# EAGLE design proto_tranc_1 (EAGLE 6.5.0)
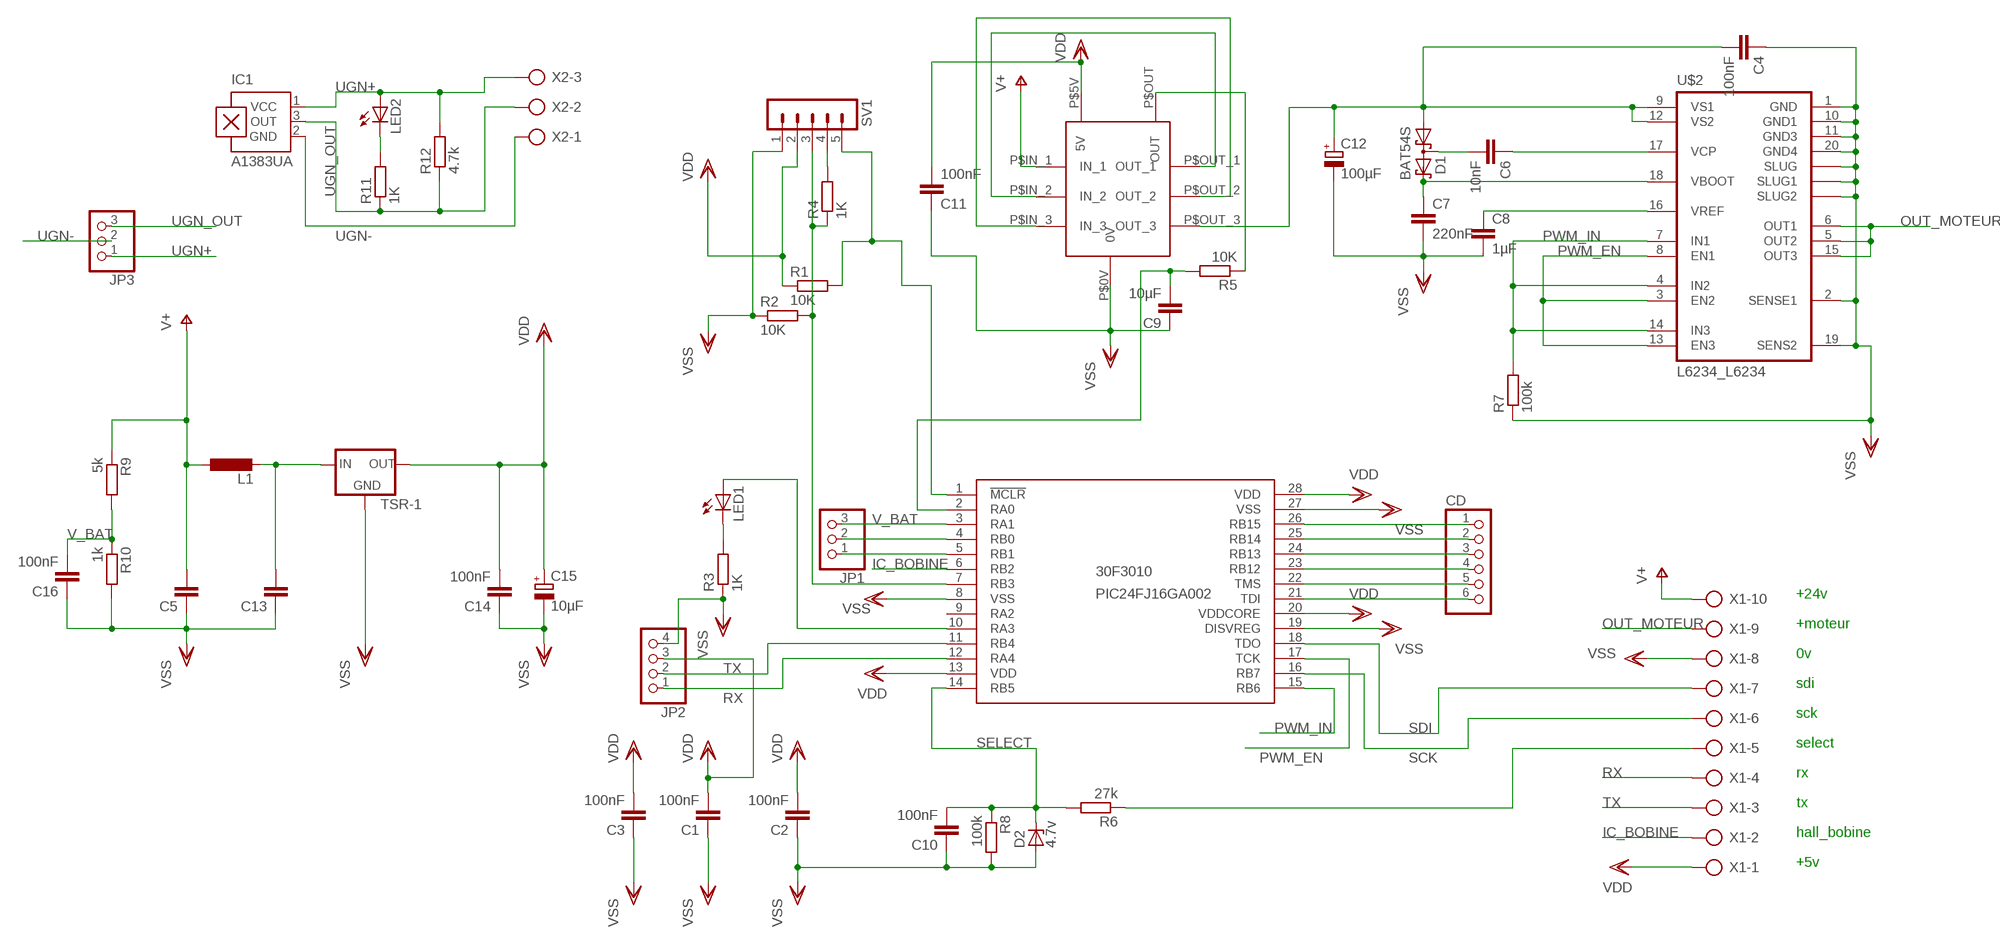
[diagram p0: schematic, sheet 1]

## Parts
30F3010  PIC24FJ16GA002  [DIL28-3]
C1  100nF  C-EUC0805K  [C0805K]
C2  100nF  C-EUC0805K  [C0805K]
C3  100nF  C-EUC0805K  [C0805K]
C4  100nF  C-EUC0805K  [C0805K]
C5  C-EUC1206K  [C1206K]
C6  10nF  C-EUC0805K  [C0805K]
C7  220nF  C-EUC0805K  [C0805K]
C8  1µF  C-EUC0805K  [C0805K]
C9  10µF  C-EUC1812  [C1812]
C10  100nF  C-EUC0805K  [C0805K]
C11  100nF  C-EUC0805K  [C0805K]
C12  100µF  CPOL-EUTT5D11L  [TT5D11L]
C13  C-EUC1206K  [C1206K]
C14  100nF  C-EUC0805K  [C0805K]
C15  10µF  CPOL-EUSMCB  [SMC_B]
C16  100nF  C-EUC0805K  [C0805K]
CD  PINHD-1X6  [1X06]
D1  BAT54S  [SOT23]
D2  4.7v  1N4728  [DO41Z10]
IC1  A1383UA  [SIP3-UA]
JP1  PINHD-1X3  [1X03]
JP2  PINHD-1X4  [1X04]
JP3  PINHD-1X3  [1X03]
L1  L-EUL2012C  [L2012C]
LED1  LEDCHIPLED_1206  [CHIPLED_1206]
LED2  LEDCHIPLED_0805  [CHIPLED_0805]
R1  10K  R-EU_M0805  [M0805]
R2  10K  R-EU_M0805  [M0805]
R3  1K  R-EU_M0805  [M0805]
R4  1K  R-EU_M0805  [M0805]
R5  10K  R-EU_M0805  [M0805]
R6  27k  R-EU_M0805  [M0805]
R7  100k  R-EU_M0805  [M0805]
R8  100k  R-EU_M0805  [M0805]
R9  5k  R-EU_M0805  [M0805]
R10  1k  R-EU_M0805  [M0805]
R11  1K  R-EU_M0805  [M0805]
R12  4.7k  R-EU_M0805  [M0805]
SV1  MA05-1  [MA05-1]
TSR-1  78XXS  [78XXS]
U$1  LTS25-NP  [LTS25]
U$2  L6234_L6234  [L6234_SO20POWER2]
X1  AK300/10  [AK300/10]
X2  AK300/3  [AK300/3]

## Nets
IC_BOBINE: 30F3010.6(RB2) X1.2
N$1: C13.2 L1.2 TSR-1.IN
N$2: U$1.P$IN_2(IN_2) U$1.P$OUT_1(OUT_1)
N$3: R4.2 SV1.4
N$4: 30F3010.26(RB15) CD.1
N$5: U$1.P$IN_3(IN_3) U$1.P$OUT_2(OUT_2)
N$6: 30F3010.10(RA3) LED1.A
N$7: C4.2 C12.+ D1.1(A1) U$1.P$OUT_3(OUT_3) U$2.9(VS1) U$2.12(VS2)
N$8: R5.1 U$1.P$OUT(OUT)
N$9: 30F3010.2(RA0) C9.2 R5.2
N$10: C6.2 D1.3(C1A2)
N$11: C6.1 U$2.17(VCP)
N$12: C7.1 D1.2(C2) U$2.18(VBOOT)
N$13: C8.1 U$2.16(VREF)
N$15: 30F3010.25(RB14) CD.2
N$16: 30F3010.1(!MCLR) R1.2 SV1.5
N$17: 30F3010.7(RB3) R2.2 R4.1 SV1.3
N$18: 30F3010.24(RB13) CD.3
N$19: 30F3010.23(RB12) CD.4
N$20: 30F3010.22(TMS) CD.5
N$21: 30F3010.21(TDI) CD.6
N$22: R6.1 X1.5
N$23: LED1.C R3.2
N$24: 30F3010.4(RB0) JP1.2
N$25: 30F3010.5(RB1) JP1.1
N$27: LED2.C R11.2
OUT_MOTEUR: U$2.5(OUT2) U$2.6(OUT1) U$2.15(OUT3) X1.9
PWM_EN: 30F3010.17(TCK) U$2.3(EN2) U$2.8(EN1) U$2.13(EN3)
PWM_IN: 30F3010.15(RB6) R7.2 U$2.4(IN2) U$2.7(IN1) U$2.14(IN3)
RX: 30F3010.12(RA4) JP2.1 X1.4
SCK: 30F3010.16(RB7) X1.6
SDI: 30F3010.18(TDO) X1.7
SELECT: 30F3010.14(RB5) C10.2 D2.C R6.2 R8.1
TX: 30F3010.11(RB4) JP2.2 X1.3
UGN+: IC1.1(VCC) JP3.1 LED2.A R12.2 X2.3
UGN-: IC1.2(GND) JP3.2 X2.1
UGN_OUT: IC1.3(OUT) JP3.3 R11.1 R12.1 X2.2
V+: C5.2 L1.1 R9.1 U$1.P$IN_1(IN_1) X1.10
V_BAT: 30F3010.3(RA1) C16.2 JP1.3 R9.2 R10.1
VDD: 30F3010.13(VDD) 30F3010.20(VDDCORE) 30F3010.28(VDD) C1.2 C2.2 C3.2 C11.2 C14.2 C15.+ JP2.3 R1.1 SV1.2 TSR-1.OUT U$1.P$5V(5V) X1.1
VSS: 30F3010.8(VSS) 30F3010.19(DISVREG) 30F3010.27(VSS) C1.1 C2.1 C3.1 C4.1 C5.1 C7.2 C8.2 C9.1 C10.1 C11.1 C12.- C13.1 C14.1 C15.- C16.1 D2.A JP2.4 R2.1 R3.1 R7.1 R8.2 R10.2 SV1.1 TSR-1.GND U$1.P$0V(0V) U$2.1(GND) U$2.2(SENSE1) U$2.10(GND1) U$2.11(GND3) U$2.19(SENS2) U$2.20(GND4) U$2.SLUG1(SLUG2) U$2.SLUG2(SLUG) U$2.SLUG(SLUG1) X1.8
Unconnected: 30F3010.9(RA2)

## Notes on the sheet
- +24v
- +moteur
- 0v
- sdi
- sck
- select
- rx
- tx
- hall_bobine
- +5v

## Library data of the parts
30F3010 = microchip:PIC24FJ16GA002: PIC24FJ16GA002 edit this description Auto generated by make-symbol-device-package-bsdl.ulp Rev. 25 Source: PIC24FJ16GA002.bsd; MPN: PIC24FJ16GA002-I/SP; OC_FARNELL: 1816078; OC_NEWARK: 40M1427
C1-C11 C13 C14 C16 = rcl:C-EU: CAPACITOR, European symbol
C12 C15 = rcl:CPOL-EU: POLARIZED CAPACITOR, European symbol
CD = pinhead:PINHD-1X6: PIN HEADER
D1 = diode:BAT54S: Schottky Diodes Pin connection corrected 2011-05-04 Source: Fairchild .. BAT54.pdf
D2 = diode:1N4728: Z DIODE 3.3 V, 1W, 5 percent
IC1 = allegro:A13*?: Linear Hall Effect Sensor ICs Continuous-Time Ratiometric High-Temperature Operation Programmable Linear with Analog Output A1302 -Replacement- UGN3503 Source: http://www.allegromicro.com/en/Products/Part_Numbers/1301/1301.pdf http://www.allegromicro.com/en/Products/Part_Numbers/1321/1321.pdf http://www.allegromicro.com/en/Products/Part_Numbers/1381/1381.pdf; MPN: A1383LUA-T; OC_FARNELL: unknown; OC_NEWARK: 30M9957
JP1 JP3 = pinhead:PINHD-1X3: PIN HEADER
JP2 = pinhead:PINHD-1X4: PIN HEADER
L1 = rcl:L-EU: INDUCTOR, European symbol
LED1 LED2 = led:LED: LED OSRAM: - CHIPLED LG R971, LG N971, LY N971, LG Q971, LY Q971, LO R971, LY R971 LH N974, LH R974 LS Q976, LO Q976, LY Q976 LO Q996 - Hyper CHIPLED LW Q18S LB Q993, LB Q99A, LB R99A - SideLED LS A670, LO A670, LY A670, LG A670, LP A670 LB A673, LV A673, LT A673, LW A673 LH A674 LY A675 LS A676, LA A676, LO A676, LY A676, LW A676 LS A679, LY A679, LG A679 - Hyper Micro SIDELED® LS Y876, LA Y876, LO Y876, LY Y876 LT Y87S - SmartLED LW L88C, LW L88S LB L89C, LB L89S, LG L890 LS L89K, LO L89K, LY L89K LS L896, LA L896, LO L896, LY L896 - TOPLED LS T670, LO T670, LY T670, LG T670, LP T670 LSG T670, LSP T670, LSY T670, LOP T670, LYG T670 LG T671, LOG T671, LSG T671 LB T673, LV T673, LT T673, LW T673 LH T674 LS T676, LA T676, LO T676, LY T676, LB T676, LH T676, LSB T676, LW T676 LB T67C, LV T67C, LT T67C, LS T67K, LO T67K, LY T67K, LW E67C LS E67B, LA E67B, LO E67B, LY E67B, LB E67C, LV E67C, LT E67C LW T67C LS T679, LY T679, LG T679 LS T770, LO T770, LY T770, LG T770, LP T770 LB T773, LV T773, LT T773, LW T773 LH T774 LS E675, LA E675, LY E675, LS T675 LS T776, LA T776, LO T776, LY T776, LB T776 LHGB T686 LT T68C, LB T68C - Hyper Mini TOPLED® LB M676 - Mini TOPLED Santana® LG M470 LS M47K, LO M47K, LY M47K Source: http://www.osram.convergy.de LUXEON: - LUMILED® LXK2-PW12-R00, LXK2-PW12-S00, LXK2-PW14-U00, LXK2-PW14-V00 LXK2-PM12-R00, LXK2-PM12-S00, LXK2-PM14-U00 LXK2-PE12-Q00, LXK2-PE12-R00, LXK2-PE12-S00, LXK2-PE14-T00, LXK2-PE14-U00 LXK2-PB12-K00, LXK2-PB12-L00, LXK2-PB12-M00, LXK2-PB14-N00, LXK2-PB14-P00, LXK2-PB14-Q00 LXK2-PR12-L00, LXK2-PR12-M00, LXK2-PR14-Q00, LXK2-PR14-R00 LXK2-PD12-Q00, LXK2-PD12-R00, LXK2-PD12-S00 LXK2-PH12-R00, LXK2-PH12-S00 LXK2-PL12-P00, LXK2-PL12-Q00, LXK2-PL12-R00 Source: www.luxeon.com KINGBRIGHT: KA-3528ASYC Source: www.kingbright.com
R1-R12 = rcl:R-EU_: RESISTOR, European symbol
SV1 = con-lstb:MA05-1: PIN HEADER; OC_FARNELL: unknown; OC_NEWARK: unknown
TSR-1 = v-reg:78XXS: VOLTAGE REGULATOR
U$1 = lem:LTS25-NP
U$2 = 009:L6234_L6234
X1 = con-ptr500:AK300/10: CONNECTOR; OC_FARNELL: unknown; OC_NEWARK: unknown
X2 = con-ptr500:AK300/3: CONNECTOR; OC_FARNELL: unknown; OC_NEWARK: unknown

## Board
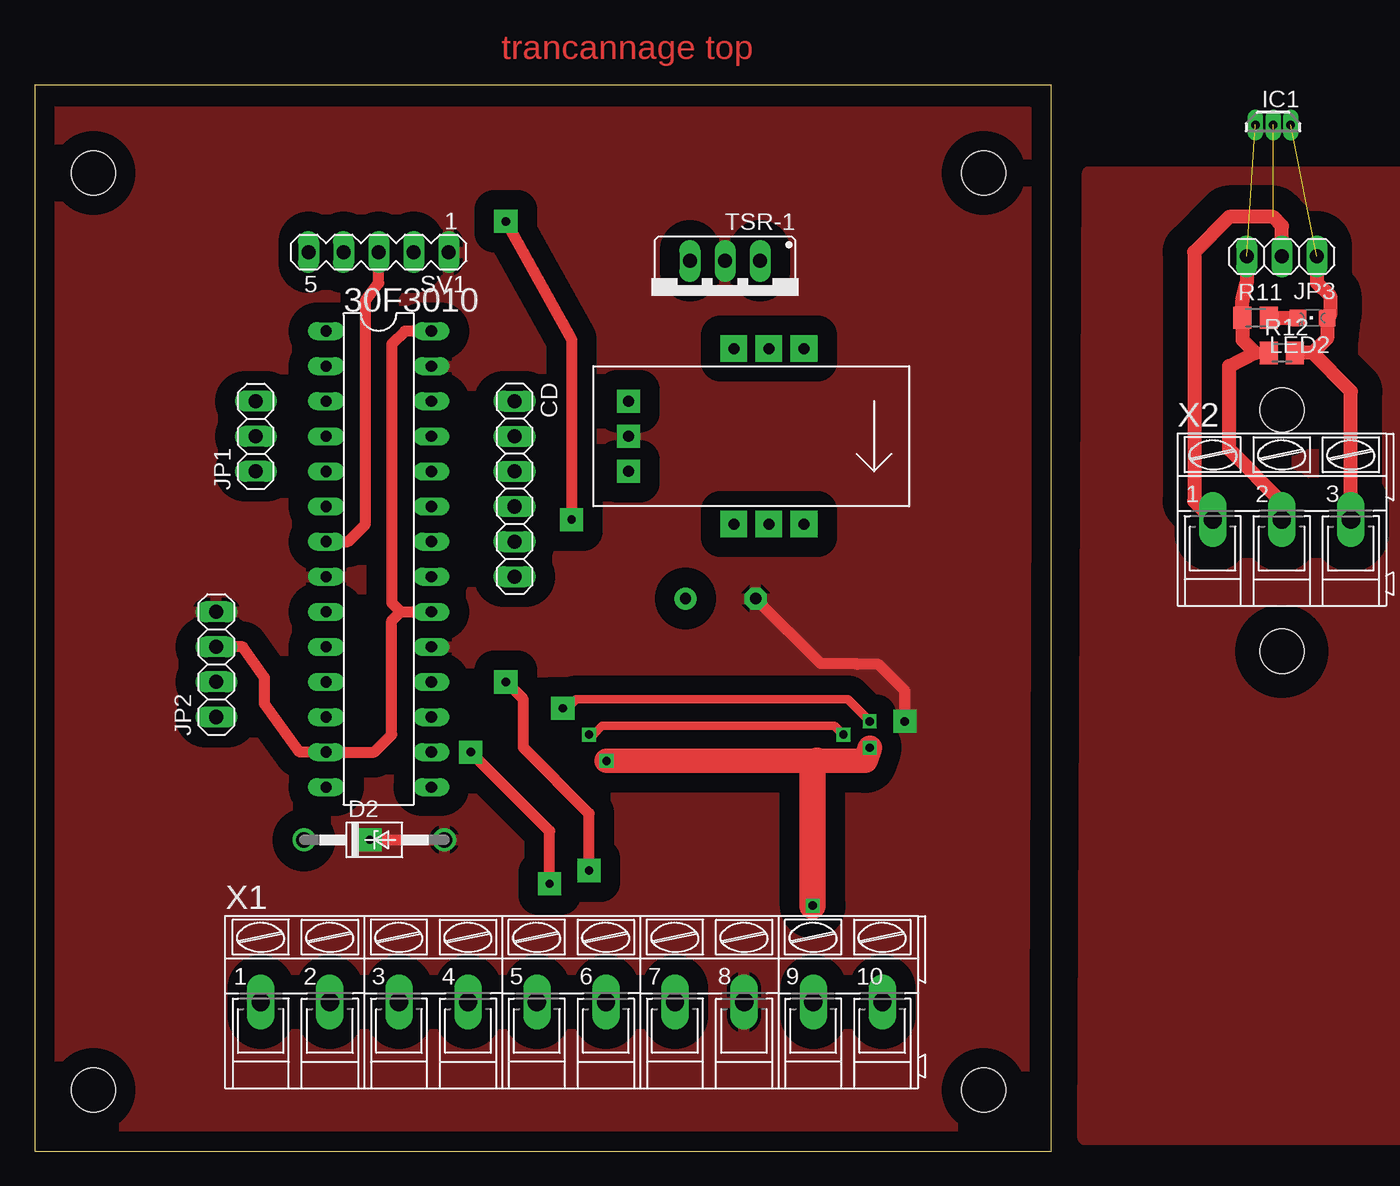
[diagram p1: board, top side]
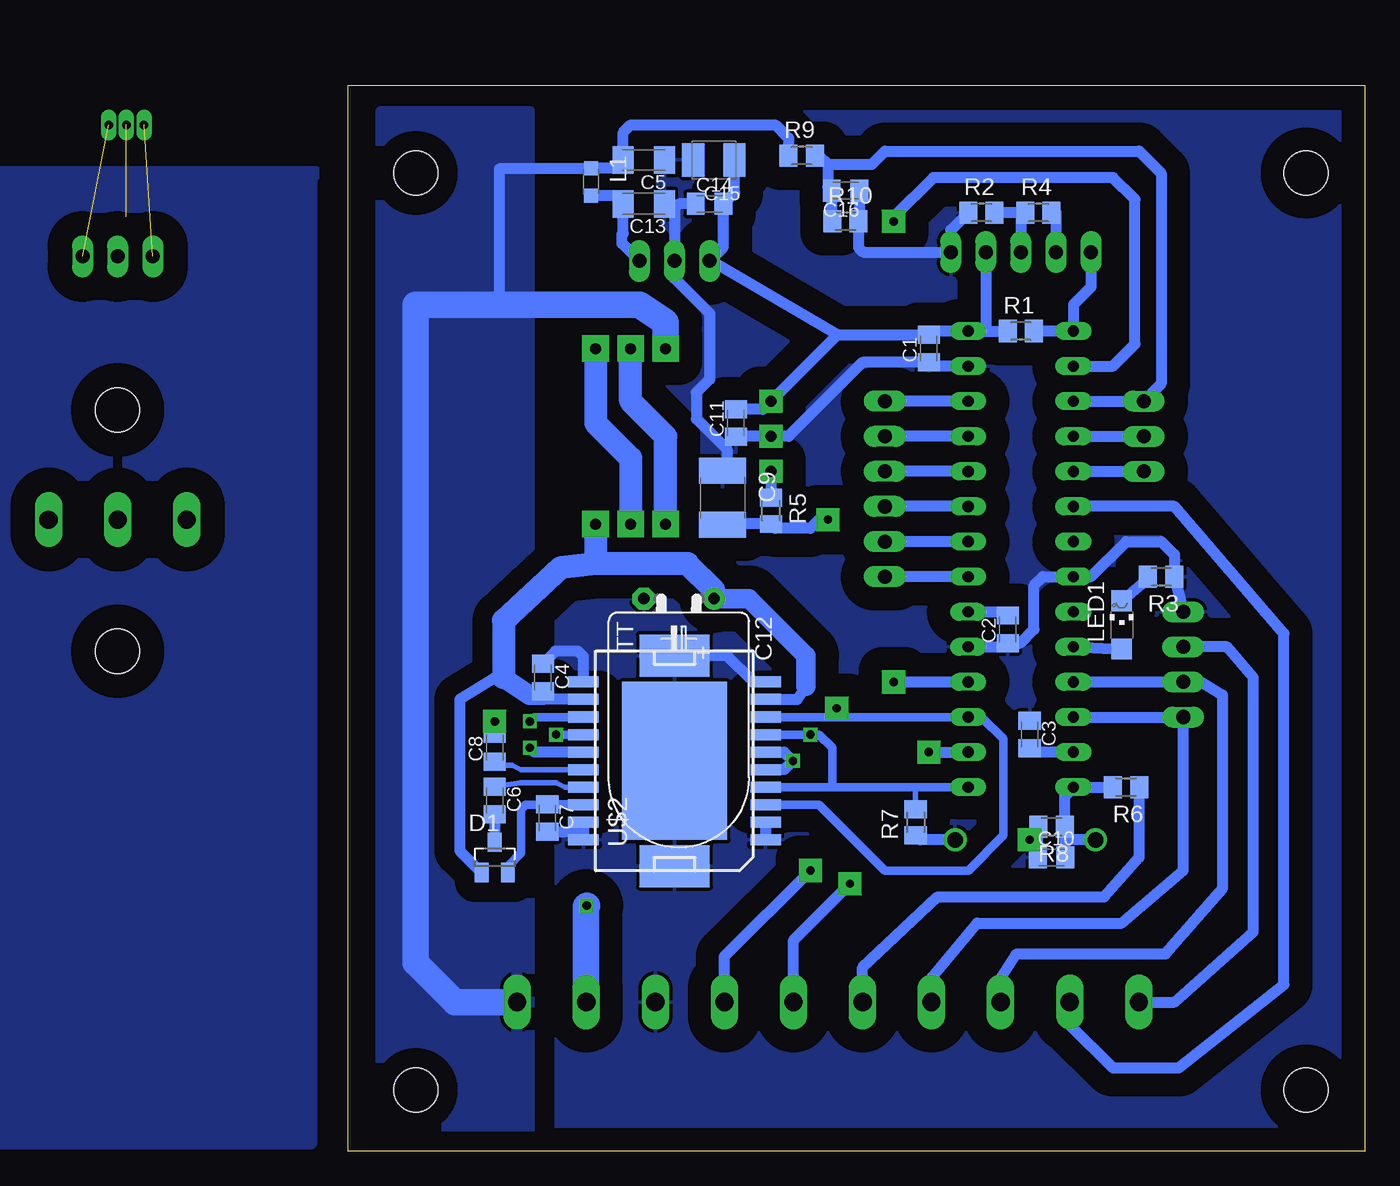
[diagram p2: board, bottom side, seen from below]

Size 73.65 x 77.14 mm. Coordinates in mm from the lower left corner, seen from the top.
Outline: 0,0 73.65,0 73.65,77.14 0,77.14 0,0
Copper layers (1*16): Top 0.035mm / dielectric 1.5mm / Bottom 0.035mm
Design rules "default": minimum track width 10mil, minimum drill 24mil, track to track 8mil, track to pad 8mil, pad to pad 8mil, via to via 8mil, smd to smd 8mil, copper to edge 40mil, drill to drill 8mil, minimum pad ring 10mil, minimum via ring 8mil, stop-mask expansion 4mil, vias tented up to drill 0mil, thermal gap 10mil
Holes 3.2 mm at 4.28,4.44 68.73,4.44 68.73,70.8 4.28,70.8 90.32,53.65 90.32,36.19

### Footprints (pad centres in the part's own frame; a part is rotated, then mirrored left to right if it is on the bottom)
DIL28-3 = drill 0.813 long: 1 -16.51,-3.81; 2 -13.97,-3.81; 3 -11.43,-3.81; 4 -8.89,-3.81; 5 -6.35,-3.81; 6 -3.81,-3.81; 7 -1.27,-3.81; 8 1.27,-3.81; 9 3.81,-3.81; 10 6.35,-3.81; 11 8.89,-3.81; 12 11.43,-3.81; 13 13.97,-3.81; 14 16.51,-3.81; 15 16.51,3.81; 16 13.97,3.81; 17 11.43,3.81; 18 8.89,3.81; 19 6.35,3.81; 20 3.81,3.81; 21 1.27,3.81; 22 -1.27,3.81; 23 -3.81,3.81; 24 -6.35,3.81; 25 -8.89,3.81; 26 -11.43,3.81; 27 -13.97,3.81; 28 -16.51,3.81
C0805K = smd 1.3 x 1.6: 1 -1,0; 2 1,0
C1206K = smd 1.5 x 2: 1 -1.5,0; 2 1.5,0
C1812 = smd 1.9 x 3.4: 1 -1.95,0; 2 1.95,0
TT5D11L = drill 0.813 pad 1.6: + -2.54,0 | drill 0.813 pad 1.6 octagon: - 2.54,0
SMC_B = smd 1.6 x 2.4: + -1.5,0; - 1.5,0
1X06 = drill 1.016 long: 1 -6.35,0; 2 -3.81,0; 3 -1.27,0; 4 1.27,0; 5 3.81,0; 6 6.35,0
SOT23 = smd 1 x 1.4: 1 -0.95,-1.1; 2 0.95,-1.1; 3 0,1.1
DO41Z10 = drill 1.118: A 5.08,0; C -5.08,0
SIP3-UA = drill 0.6 pad 0.7 long: 1 -1.27,0; 2 0,0; 3 1.27,0
1X03 = drill 1.016 long: 1 -2.54,0; 2 0,0; 3 2.54,0
1X04 = drill 1.016 long: 1 -3.81,0; 2 -1.27,0; 3 1.27,0; 4 3.81,0
L2012C = smd 1 x 1: 1 -1,0; 2 1,0
CHIPLED_1206 = smd 1.5 x 1.5: A 0,-1.75; C 0,1.75
CHIPLED_0805 = smd 1.2 x 1.2: A 0,-1.05; C 0,1.05
M0805 = smd 1.3 x 1.6: 1 -0.95,0; 2 0.95,0
MA05-1 = drill 1.016 long: 1 -5.08,0; 2 -2.54,0; 3 0,0; 4 2.54,0; 5 5.08,0
78XXS = drill 1.016 long: GND 0,-2.54; IN -2.54,-2.54; OUT 2.54,-2.54
LTS25 = drill 0.8 pad 1.676 square: P$0V -10.16,0; P$5V -10.16,2.54; P$OUT -10.16,-2.54 | drill 0.8 pad 1.93 square: P$IN_1 -2.54,6.35; P$IN_2 0,6.35; P$IN_3 2.54,6.35; P$OUT_1 -2.54,-6.35; P$OUT_2 0,-6.35; P$OUT_3 2.54,-6.35
L6234_SO20POWER2 = smd 0.8 x 2.2: 1 -5.715,-6.6; 2 -4.445,-6.6; 3 -3.175,-6.6; 4 -1.905,-6.6; 5 -0.635,-6.6; 6 0.635,-6.6; 7 1.905,-6.6; 8 3.175,-6.6; 9 4.445,-6.6; 10 5.715,-6.6; 11 5.715,6.6; 12 4.445,6.6; 13 3.175,6.6; 14 1.905,6.6; 15 0.635,6.6; 16 -0.635,6.6; 17 -1.905,6.6; 18 -3.175,6.6; 19 -4.445,6.6; 20 -5.715,6.6 | smd 3.048 x 5.08: SLUG -7.62,0; SLUG2 7.62,0 | smd 11.43 x 7.62: SLUG1 0,0
AK300/10 = drill 1.321 long: 1 -22.504,0; 2 -17.501,0; 3 -12.497,0; 4 -7.493,0; 5 -2.515,0; 6 2.489,0; 7 7.493,0; 8 12.497,0; 9 17.501,0; 10 22.504,0
AK300/3 = drill 1.321 long: 1 -5.004,0; 2 0,0; 3 5.004,0

### Placement (x,y rotation side)
30F3010  24.92,42.86 270 top
C1  31.58,58.1 90 bottom
C2  25.87,37.78 90 bottom
C3  24.28,30.16 270 bottom
C4  59.52,34.29 270 bottom
C5  52.22,71.75 180 bottom
C6  63.02,25.39 270 bottom
C7  59.21,24.12 270 bottom
C8  63.02,29.2 90 bottom
C9  46.51,47.3 270 bottom
C10  22.7,21.27 0 bottom
C11  45.55,52.7 90 bottom
C12  49.68,40 180 bottom
C13  52.22,68.57 180 bottom
C14  47.46,68.57 0 bottom
C15  47.14,71.75 180 bottom
C16  37.62,69.53 180 bottom
CD  34.76,47.94 270 top
D1  63.02,21.27 0 bottom
D2  24.6,22.54 0 top
IC1  89.69,74.29 180 top  (outside the outline)
JP1  16.03,51.75 90 top
JP2  13.17,35.24 90 top
JP3  90.32,64.77 180 top  (outside the outline)
L1  56.03,70.16 270 bottom
LED1  17.61,38.1 0 bottom
LED2  92.55,60.32 90 top  (outside the outline)
R1  24.92,59.37 0 bottom
R2  27.77,67.94 0 bottom
R3  14.76,41.59 180 bottom
R4  23.65,67.94 0 bottom
R5  43.02,46.35 270 bottom
R6  17.3,26.35 180 bottom
R7  32.54,23.81 90 bottom
R8  22.7,23.49 180 bottom
R9  40.79,72.07 0 bottom
R10  37.62,67.3 0 bottom
R11  88.42,60.32 0 top  (outside the outline)
R12  90.32,57.78 0 top  (outside the outline)
SV1  24.92,65.08 180 top
TSR-1  50,61.91 180 top
U$1  53.17,51.75 0 top
U$2  50,28.25 90 bottom
X1  38.89,10.79 0 top
X2  90.32,45.72 0 top  (outside the outline)

### Tracks (layer width: path | path; a pad name or v marks a point on that pad's centre or on a via)
IC_BOBINE  (via drill 0.6)
  Top 0.813: X1.2 v21.42,10.79
  Bottom 0.813: v21.42,10.79 21.42,9.2 18.25,6.03 13.49,6.03 5.87,12.06 5.87,37.46 13.81,46.67 30F3010.6
N$1
  Bottom 0.813: TSR-1.IN 53.81,65.72 53.81,66.35 53.72,66.44 C13.2 54.31,69.16 L1.2
N$2
  Bottom 1.676: U$1.P$OUT_1 50.63,51.75 53.17,54.29 U$1.P$IN_2
N$3
  Bottom 0.813: R4.2 22.38,67.94 SV1.4
N$4
  Bottom 0.813: 30F3010.26 CD.1
N$5
  Bottom 1.676: U$1.P$IN_3 55.71,52.7 53.17,50.16 U$1.P$OUT_2
N$6
  Bottom 0.813: 30F3010.10 LED1.A
N$7
  Bottom 0.406: 59.48,32.7 C4.2
  Bottom 0.813: U$2.12 59.48,32.7 | U$2.9 41.11,32.7 40.48,33.65 | C12.+ 47.14,40.64 | 59.57,33.02 C4.2 | 62.38,34.29 63.02,34.29 65.56,32.7 65.56,21.76 D1.1
  Bottom 1.422: 40.48,33.65 40.48,35.87 44.6,40 C12.+ | 62.38,34.29 60.48,33.02 59.57,33.02
  Bottom 1.676: 47.14,40.64 49.05,42.54 55.71,42.54 | 55.71,42.54 58.25,42.22 62.38,38.41 62.38,34.29 | U$1.P$OUT_3 55.71,42.54
N$8
  Bottom 0.813: U$1.P$OUT R5.1
N$9  (via drill 0.6 pad 1.68)
  Top 0.813: v34.12,67.3 38.89,58.73 v38.89,45.72
  Bottom 0.813: 30F3010.2 18.25,56.83 16.66,58.41 16.66,68.89 18.25,70.48 31.27,70.48 34.12,67.62 v34.12,67.3 | v38.89,45.72 39.52,45.72 40.16,45.08 42.7,45.08 R5.2 46.46,45.4 C9.2
N$10
  Bottom 0.813: C6.2 D1.3
N$11
  Bottom 0.406: U$2.17 57.94,26.35 58.57,26.66 61.16,26.66 C6.1
N$12
  Bottom 0.61: U$2.18 56.6,25.12 C7.1 59.25,25.08 60.8,25.08 61.11,24.76 61.11,21.58 62.07,20.63 D1.2
N$13
  Bottom 0.406: U$2.16 61.11,27.62 61.75,27.93 63.38,27.93 C8.1
N$14
  pour Top (isolate 1.778): 76.35,70.8 104.29,70.8 103.97,0.95 76.03,0.95
N$15
  Bottom 0.813: 30F3010.25 CD.2
N$16
  Bottom 0.813: R1.2 30F3010.1 21.11,61.27 19.84,62.54 SV1.5
N$17
  Top 0.813: 30F3010.7 22.7,44.13 23.96,45.4 23.96,61.59 24.92,62.86 SV1.3
  Bottom 0.813: R4.1 24.92,67.94 | 24.92,67.94 SV1.3 | 24.92,67.94 R2.2
N$18
  Bottom 0.813: 30F3010.24 CD.3
N$19
  Bottom 0.813: 30F3010.23 CD.4
N$20
  Bottom 0.813: 30F3010.22 CD.5
N$21
  Bottom 0.813: 30F3010.21 CD.6
N$22
  Bottom 0.813: X1.5 36.37,13.31 30.95,18.41 18.88,18.41 16.34,21.27 R6.1
N$23
  Bottom 0.813: R3.2 15.71,41.43 LED1.C
N$24
  Bottom 0.813: 30F3010.4 JP1.2
N$25
  Bottom 0.813: 30F3010.5 JP1.1
N$26
  pour Bottom (isolate 1.778): 76.03,70.8 104.29,70.8 104.29,0.63 76.35,0.63 76.35,70.48
N$27
  Top 1.016: R11.2 LED2.C
OUT_MOTEUR  (via drill 0.6)
  Top 1.778: v60.48,29.2 60.16,28.25 56.67,28.25 v41.43,28.25
  Top 1.93: v56.35,17.77 56.35,27.93 56.67,28.25
  Bottom 0.813: U$2.15 60.16,28.89 v60.48,29.2 | U$2.5 42.06,27.62 v41.43,28.25 42.06,28.89 U$2.6
  Bottom 1.93: X1.9 56.39,17.74 v56.35,17.77
PWM_EN  (via drill 0.6, 0.6 pad 1.68)
  Top 0.61: v60.48,31.11 58.89,32.7 39.2,32.7 38.57,32.06 v38.25,32.06
  Bottom 0.406: 27.77,31.43 30F3010.17 | 60.16,31.43 v60.48,31.11 | v38.25,32.06 37.94,31.74 37.94,31.43
  Bottom 0.61: U$2.3 39.52,25.08 34.76,20.31 28.73,20.31 26.19,22.86 26.19,29.84 27.77,31.43 | 30F3010.17 37.94,31.43 U$2.8 | U$2.13 60.16,31.43
PWM_IN  (via drill 0.6)
  Top 0.61: v58.57,30.16 57.94,30.79 41.11,30.79 40.48,30.16 v40.16,30.16
  Bottom 0.406: R7.2 32.54,26.35 | v40.16,30.16 39.52,30.16
  Bottom 0.61: U$2.4 38.57,26.35 | 38.57,26.35 32.54,26.35 30F3010.15 | U$2.7 v40.16,30.16 | 39.52,30.16 38.57,29.2 38.57,26.35 | U$2.14 v58.57,30.16
RX
  Bottom 0.813: 30F3010.12 JP2.1 | 12.54,31.43 JP2.1 | X1.4 31.39,12.57 28.09,16.5 17.61,16.5 13.17,20.31 JP2.1
SCK  (via drill 0.6 pad 1.68)
  Top 0.813: v37.3,19.36 37.3,23.17 v31.58,28.89
  Bottom 0.813: X1.6 41.38,15.29 v37.3,19.36 | v31.58,28.89 30F3010.16
SDI  (via drill 0.6 pad 1.68)
  Top 0.813: v40.16,20.31 40.16,24.44 35.39,29.2 35.39,32.7 v34.12,33.97
  Bottom 0.813: X1.7 46.38,14.09 v40.16,20.31 | v34.12,33.97 30F3010.18
SELECT
  Bottom 0.813: R6.2 30F3010.14 21.74,25.71 R8.1 | C10.2 21.7,22.8 R8.1 | D2.C 21.43,22.54 R8.1
TX
  Bottom 0.813: 30F3010.11 JP2.2 | 12.54,33.97 JP2.2 | X1.3 26.39,12.49 25.23,14.28 14.44,14.28 10.31,19.04 10.31,33.02 11.9,33.97 JP2.2
UGN+  (1 unrouted)
  Top 0.813: 93.81,60.54 LED2.A
  Top 1.016: JP3.1 92.86,62.86 93.81,61.91 93.81,60.54 | LED2.A 93.59,58.83 92.55,57.78 | 92.55,57.78 R12.2 | X2.3 95.33,55 92.55,57.78
UGN-  (1 unrouted)
  Top 1.016: JP3.2 90.32,66.99 89.69,67.62 86.51,67.62 83.97,65.08 83.97,47.06 X2.1
UGN_OUT  (1 unrouted)
  Top 0.813: 88.42,57.78 R12.1
  Top 1.016: JP3.3 87.78,62.86 87.47,61.6 R11.1 87.47,58.73 88.42,57.78 86.52,56.83 86.52,50.79 90.32,46.98 X2.2
V+
  Bottom 0.813: 50.63,60 50.63,60.32 | R9.1 41.74,73.34 42.7,74.29 53.17,74.29 53.72,73.74 C5.2 54.31,71.16 L1.1 56.08,71.11 62.7,71.11 62.7,61.27
  Bottom 1.93: X1.10 65.88,10.79 68.73,13.65 68.73,61.27 62.7,61.27 52.54,61.27 50.63,60 U$1.P$IN_1
  pour Bottom (isolate 1.422): 60.48,75.24 71.27,75.24 71.27,0.63 60.48,0.63
V_BAT
  Bottom 0.813: 30F3010.3 JP1.3 14.76,55.56 14.76,70.8 16.34,72.38 34.76,72.38 35.71,71.43 38.89,71.43 | R9.2 39.52,72.07 38.89,71.43 | 38.89,71.43 38.89,69.8 C16.2 38.62,67.35 R10.1
VDD
  Top 0.813: JP2.3 15.08,36.51 16.66,34.29 16.66,32.38 19.2,28.89 30F3010.13 24.6,28.89 25.87,30.16 25.87,38.41 26.5,39.05 | 26.5,39.05 30F3010.20 | 30F3010.28 26.82,59.37 25.87,58.41 25.87,39.68 26.5,39.05
  Bottom 0.813: 27.77,59.37 30F3010.28 31.31,59.37 C1.2 38.2,59.1 | 27.77,59.37 R1.1 | SV1.2 27.46,59.69 27.77,59.37 | 30F3010.20 26.14,39.05 C2.2 | 30F3010.13 24.01,28.89 C3.2 | C11.2 43.6,53.7 U$1.P$5V 38.2,59.1 | C15.+ 45.64,69.39 C14.2 46.46,65.45 TSR-1.OUT 47.37,64.45 38.2,59.1 | X1.1 13.81,10.79 8.09,15.87 8.09,34.29 10,36.51 JP2.3
VSS  (via drill 0.6 pad 1.68)
  Top 0.813: v24.28,22.54 D2.A | v63.02,31.11 63.02,33.33 61.11,35.24 59.57,35.24 C4.1 56.94,35.29 C12.-
  Bottom 0.813: 30F3010.27 31.31,56.83 C1.1 36.39,57.1 41.74,51.75 U$1.P$0V 45.51,51.75 C11.1 | 30F3010.19 26.14,36.51 C2.1 24.96,36.78 23.96,37.78 23.96,40.95 23.33,41.59 30F3010.8 19.84,41.59 17.3,44.13 14.76,44.13 13.81,43.18 R3.1 JP2.4 | R2.1 30,66.67 SV1.1 36.35,65.08 36.67,65.4 R10.2 36.62,67.35 C16.1 | D2.A 32.22,22.54 R7.1 | C10.1 23.7,23.12 | R8.2 23.7,23.44 23.7,23.12 | U$2.11 56.6,35.8 56.98,36.19 58.62,36.19 C4.1 | U$2.10 44.28,33.97 46.19,35.87 U$2.SLUG2 | U$2.2 U$2.1 | U$2.19 56.6,23.17 | 56.6,23.17 U$2.20 | C7.2 56.65,23.12 56.6,23.17 | C14.1 49.68,68.57 50,68.26 50,63.18 47.46,60.64 47.46,55.88 48.41,54.92 48.41,53.02 46.19,50.8 46.19,49.57 C9.1 | 23.7,23.12 v24.28,22.54 | C8.2 v63.02,31.11
  pour Bottom (isolate 1.676): 1.1,75.24 58.57,75.24 58.57,0.31 1.42,0.31
  pour Top (isolate 1.422): 0.79,75.24 71.91,75.24 71.59,0.63 1.1,0.63

### Text on the board
Top: trancannage top
Bottom: trancannage bottom